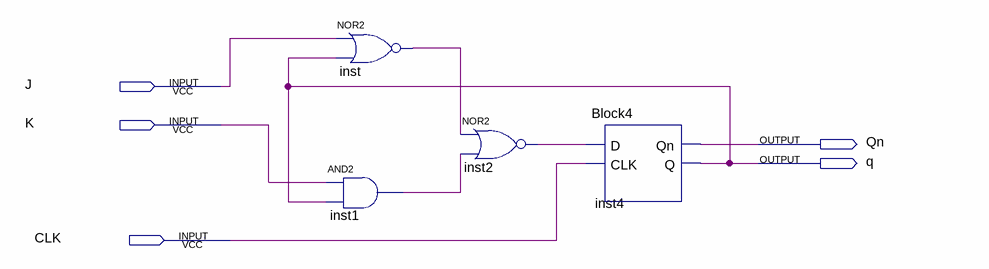
[diagram p0: schematic sheet]
// Quartus schematic Block5.bdf as structural Verilog: 4 symbols, 5 pins
module Block5 (
  input  J,
  input  K,
  input  CLK,
  output Qn,
  output q
);

  wire inst1_out, inst2_out, inst_out;

  nor inst (inst_out, J, q);
  and inst1 (inst1_out, K, q);
  nor inst2 (inst2_out, inst_out, inst1_out);
  Block4 inst4 (.D(inst2_out), .CLK(CLK), .Qn(Qn), .Q(q));
endmodule
